# Altium project PCB_Project.PrjPcb
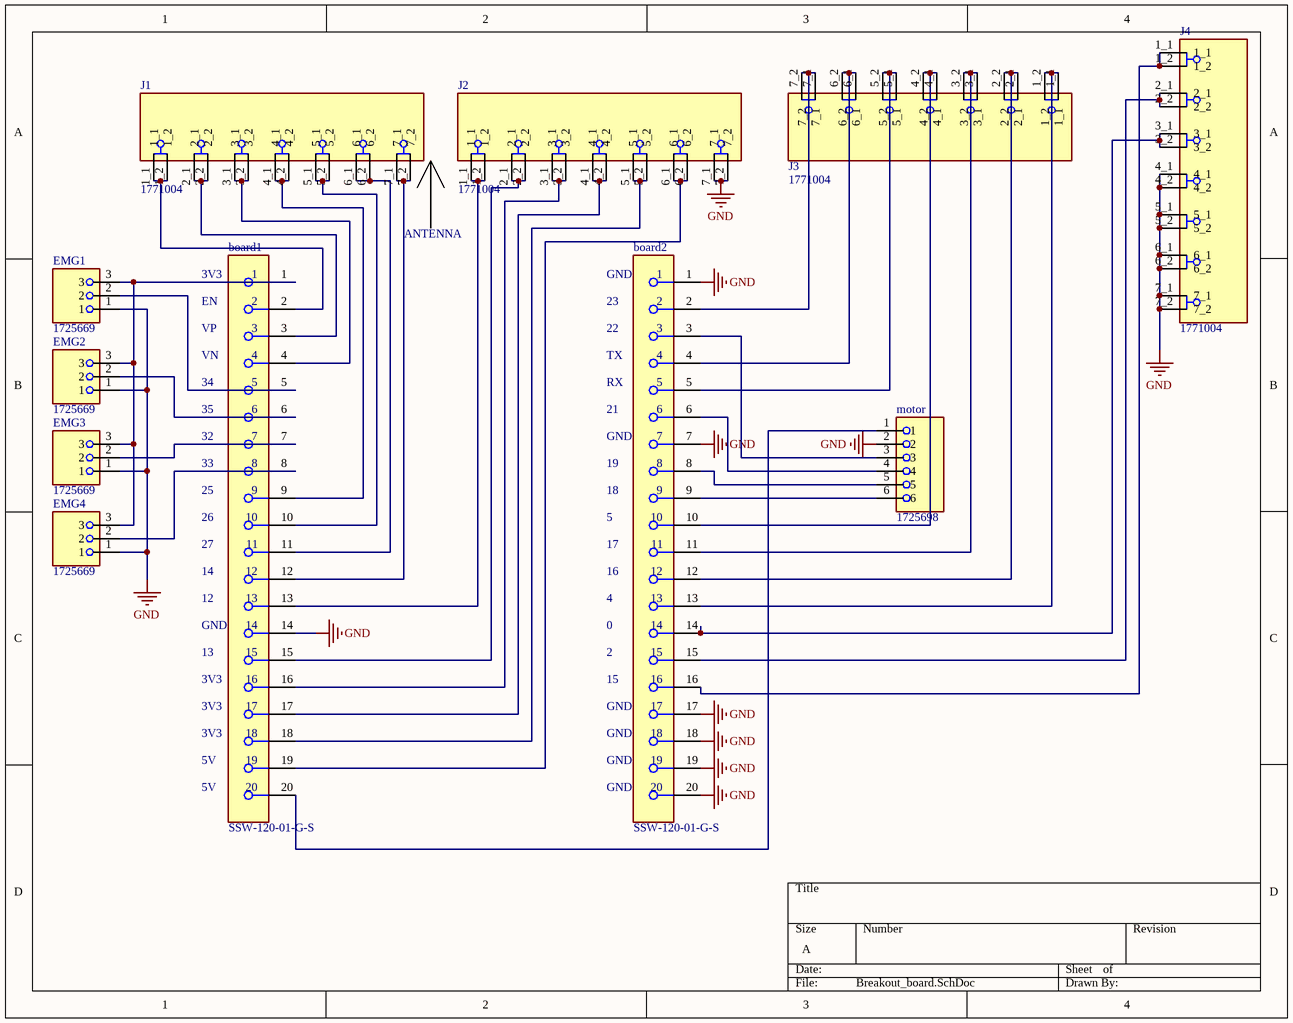
[diagram p0: Breakout_board.SchDoc]
1 sheet, 11 parts. Net scope: global (net labels, ports and power ports of the same name join across sheets).
Board file: Breakout_board.PcbDoc

## Sheet Breakout_board.SchDoc
size A; SheetNumber: 1; SheetTotal: 1

### Parts
board1  SSW-120-01-G-S  [FP-SSW-120-01-G-S-MFG]
board2  SSW-120-01-G-S  [FP-SSW-120-01-G-S-MFG]
EMG1  1725669  [PHOENIX_1725669]
EMG2  1725669  [PHOENIX_1725669]
EMG3  1725669  [PHOENIX_1725669]
EMG4  1725669  [PHOENIX_1725669]
J1  1771004  [PHOENIX_1771004]
J2  1771004  [PHOENIX_1771004]
J3  1771004  [PHOENIX_1771004]
J4  1771004  [PHOENIX_1771004]
motor  1725698  [PHOENIX_1725698]

### Nets
GND: board1.14 board2.1 board2.7 board2.17 board2.18 board2.19 board2.20 EMG1.1 EMG2.1 EMG3.1 EMG4.1 J2.7_1 J2.7_2 J4.4_1 J4.4_2 J4.5_1 J4.5_2 J4.6_1 J4.6_2 J4.7_1 J4.7_2 motor.2
Netboard1_1: board1.1 EMG1.3 EMG2.3 EMG3.3 EMG4.3
Netboard1_2: board1.2 J1.1_1 J1.1_2
Netboard1_3: board1.3 J1.2_1 J1.2_2
Netboard1_4: board1.4 J1.3_1 J1.3_2
Netboard1_5: board1.5 EMG1.2
Netboard1_6: board1.6 EMG2.2
Netboard1_7: board1.7 EMG3.2
Netboard1_8: board1.8 EMG4.2
Netboard1_9: board1.9 J1.4_1 J1.4_2
Netboard1_10: board1.10 J1.5_1 J1.5_2
Netboard1_11: board1.11 J1.6_1 J1.6_2
Netboard1_12: board1.12 J1.7_1 J1.7_2
Netboard1_13: board1.13 J2.1_1 J2.1_2
Netboard1_15: board1.15 J2.2_1 J2.2_2
Netboard1_16: board1.16 J2.3_1 J2.3_2
Netboard1_17: board1.17 J2.4_1 J2.4_2
Netboard1_18: board1.18 J2.5_1 J2.5_2
Netboard1_19: board1.19 J2.6_1 J2.6_2
Netboard1_20: board1.20 motor.1
Netboard2_2: board2.2 J3.7_1 J3.7_2
Netboard2_3: board2.3 motor.3
Netboard2_4: board2.4 J3.6_1 J3.6_2
Netboard2_5: board2.5 J3.5_1 J3.5_2
Netboard2_6: board2.6 motor.4
Netboard2_8: board2.8 motor.5
Netboard2_9: board2.9 motor.6
Netboard2_10: board2.10 J3.4_1 J3.4_2
Netboard2_11: board2.11 J3.3_1 J3.3_2
Netboard2_12: board2.12 J3.2_1 J3.2_2
Netboard2_13: board2.13 J3.1_1 J3.1_2
Netboard2_14: board2.14 J4.3_1 J4.3_2
Netboard2_15: board2.15 J4.2_1 J4.2_2
Netboard2_16: board2.16 J4.1_1 J4.1_2

### Notes on the sheet
- ANTENNA
- (near board1) 3V3
- (near board2) GND
- EN
- VP
- VN
- 23
- 22
- TX
- 34
- 35
- RX
- 21
- 32
- 33
- 25
- 19
- 18
- 26
- 27
- 5
- 17
- 14
- 12
- (near board1) GND
- 16
- 4
- 0
- 13
- 2
- 15
- 5V

### Library data of the parts
board1 board2 = CMP-00575-00296075-1: SSW-120-01-G-S SSW - Samtec 2.54mm Single Row Straight Socket Strip 8.5 Profile (mcv)(TO22); NexarPartId: 296075; Manufacturer Lifecycle Status: PRODUCTION; Number of Contacts: 20; Gender: Receptacle; Connector Type: Receptacle, Socket; Contact Resistance: 10mΩ; Voltage Rating: 550V; Voltage Rating (DC): 655V; Voltage Rating (AC): 465V; Current Rating: 6.9A; Lead Length: 2.64mm; Housing Material: Polymer; Lead Free: Lead Free; Depth: 2.41mm; Termination: Solder; Radiation Hardening: No; Contact Material: Bronze; Lead Pitch: 2.54mm; Number of Rows: 1; Orientation: Straight; Housing Color: Black; Max Voltage Rating (AC): 550V; RoHS: Compliant; Pitch: 2.54mm; Lifecycle Status: Production; Mount: Through Hole; Color: Black; REACH SVHC: No SVHC; Min Operating Temperature: -55°C; Contact Plating: Gold; Length: 51.31mm; Max Operating Temperature: 125°C; Max Current Rating: 6.9A; Number of Positions: 20
EMG1-EMG4 = 1725669: PCB Terminal Screw 2.54mm 20AWG 160V 6A 3 Position COMBICON MPT Series | Phoenix Contact 1725669; SnapEDA_Link: https://www.snapeda.com/parts/1725669/Phoenix+Contact/view-part/?ref=snap; Package: None; Value: *; MF: Phoenix Contact; MP: 1725669; Check_prices: https://www.snapeda.com/parts/1725669/Phoenix+Contact/view-part/?ref=eda
J1-J4 = 1771004: PCB Terminal Push-In 2.5mm 20AWG 160V 6A 7 Position COMBICON PTSM Series | Phoenix Contact 1771004; MPN: 1771004; DATASHEET_URL: https://s3.amazonaws.com/snapeda/datasheet/1771004_Phoenix_Contact.pdf; SOURCE_URL: https://www.snapeda.com/parts/1771004/Phoenix+Contact/view-part/; Value: *; MANUFACTURER: Phoenix Contact
motor = 1725698: PCB Terminal Screw 2.54mm 20AWG 160V 6A 6 Position COMBICON MPT Series | Phoenix Contact 1725698; SnapEDA_Link: https://www.snapeda.com/parts/1725698/Phoenix+Contact/view-part/?ref=snap; Package: None; Value: *; MF: Phoenix Contact; MP: 1725698; Check_prices: https://www.snapeda.com/parts/1725698/Phoenix+Contact/view-part/?ref=eda